# Altium schematic sheet VIDEO_Interface.SchDoc
size A4; SheetNumber: 9; SheetTotal: 16
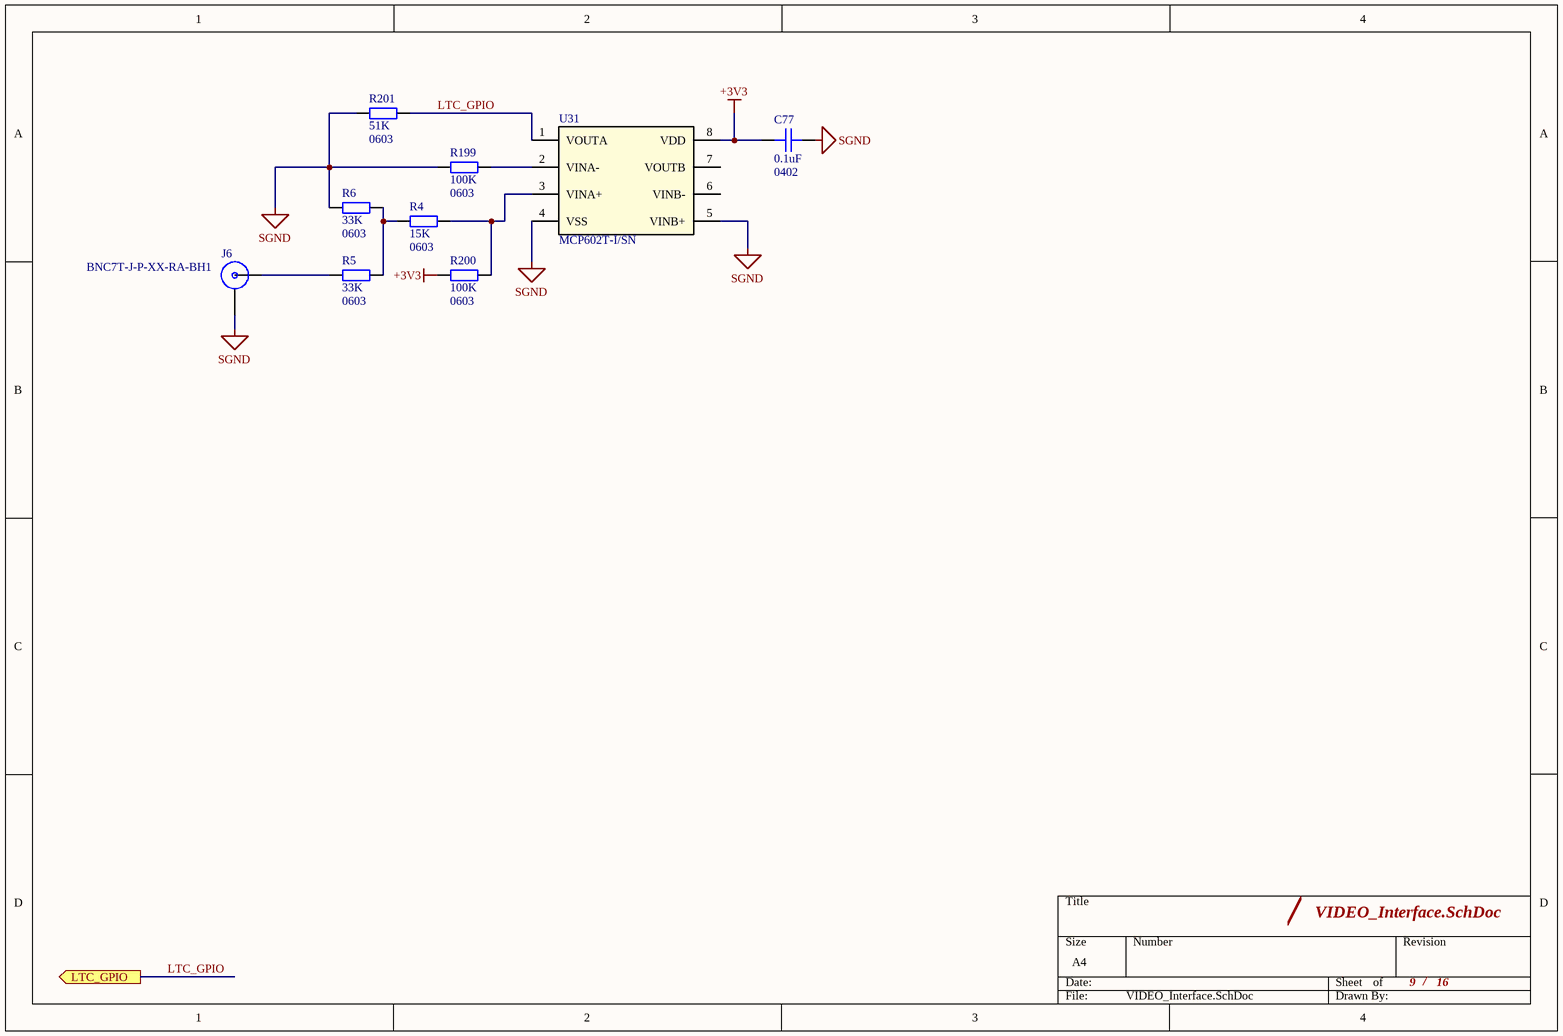
[diagram p0: VIDEO_Interface.SchDoc]

## Parts
C77  Capacitance: 0.1uF  Package1: 0402  [CAPC100x50x50L25]  (hidden comment: 04023C104KAT2A)
J6  BNC7T-J-P-XX-RA-BH1  [SAMTEC_BNC7T-J-P-XX-RA-BH1]
R4  Resistance: 15K  Size2: 0603  [RESC160X80X55L30]  (hidden comment: RC0603FR-0715KL)
R5  Resistance: 33K  Size2: 0603  [RESC160X80X55L30]  (hidden comment: RC0603FR-0733KL)
R6  Resistance: 33K  Size2: 0603  [RESC160X80X55L30]  (hidden comment: RC0603FR-0733KL)
R199  Resistance: 100K  Size2: 0603  [RESC160X80X55L30]  (hidden comment: RC0603FR-07100KL)
R200  Resistance: 100K  Size2: 0603  [RESC160X80X55L30]  (hidden comment: RC0603FR-07100KL)
R201  Resistance: 51K  Size2: 0603  [RESC160X80X55L30]  (hidden comment: RC0603FR-0751KP)
U31  MCP602T-I/SN  [SOIC8-N_MC_MCH]

## Ports
LTC_GPIO (out)

## Nets
+3V3: C77.2 R200.1 U31.8(VDD)
SGND: C77.1 J6.2 R6.1 R199.1 R201.2 U31.4(VSS) U31.5(VINB+)
LTC_GPIO: R201.1 U31.1(VOUTA) ; port LTC_GPIO
NetJ6_1: J6.1 R5.2
NetR4_1: R4.1 R5.1 R6.2
NetR4_2: R4.2 R200.2 U31.3(VINA+)
NetR199_2: R199.2 U31.2(VINA-)

Not connected (* = marked no-connect by the designer): U31 6(VINB-) 7(VOUTB)

## Notes on the sheet
- /

## Library data of the parts
C77 = CMP-001-0374-4: 0402 25V X7R 100 NF 10%; Manufacturer: KYOCERA AVX; Op Temp max: 85°C; Op Temp min: -55°C; ComponentLink3URL: https://www.digikey.com/en/products/detail/yageo/CC0402MRX5R5BB106/5195138; MPN: 04023C104KAT2A; ComponentLink1URL: https://www.yageo.com/upload/media/product/productsearch/datasheet/mlcc/UPY-GPHC_X5R_4V-to-50V_26.pdf; Package: 0402 (1005 Metric); Size: 1.00mm x 0.50mm; Height max: 700µm; Mounting Type: SM; Tolerance: 10%; ComponentLink1Description: Datasheet; ComponentLink3Description: Digikey; Ratings: -; Dielectric: X7R; ComponentLink2Description: Mouser; ComponentLink2URL: https://eu.mouser.com/ProductDetail/YAGEO/CC0402MRX5R5BB106?qs=zEY9bCHj09eCmUJdZuS5Lg%3D%3D; Lead Spacing: 0mm; Component Type: Ceramic Capacitor; Voltage Rating: 25V
J6 = BNC7T-J-P-XX-RA-BH1: CONN BNC JACK R/A 75 OHM PCB; MPN: BNC7T-J-P-HN-RA-BH1; MF: Samtec; Check_prices: https://www.snapeda.com/parts/BNC7T-J-P-HN-RA-BH1/Samtec+Inc./view-part/?ref=eda; Availability: In Stock; Price: None; Package: None; SnapEDA_Link: https://www.snapeda.com/parts/BNC7T-J-P-HN-RA-BH1/Samtec+Inc./view-part/?ref=snap; Purchase-URL: https://pricing.snapeda.com/search/part/BNC7T-J-P-HN-RA-BH1/?ref=eda; ComponentLink1Description: DigiKey; ComponentLink1URL: https://www.digikey.com/en/products/detail/samtec-inc/BNC7T-J-P-HN-RA-BH1/6642961; ComponentLink2Description: Datasheet; ComponentLink2URL: https://suddendocs.samtec.com/prints/bnc7t-j-p-xx-ra-bh1-mkt.pdf
R4 = CMP-001-0628-7: RES 15K OHM 1% 1/10W 0603; Manufacturer: YAGEO; Power: 100mW; Temperature Coefficient: ±100ppm; Op Temp max: 155°C; Op Temp min: -55°C; Ratings: -; ComponentLink3URL: https://www.digikey.com/en/products/detail/yageo/RC0603FR-0710KL/726880?s=N4IgTCBcDaIEoGEAMA2JBmAYnAtEg7AIxIDSAMiALoC%2BQA; Size: 1.60mm x 0.80mm; ComponentLink1Description: Datasheet; ComponentLink3Description: Digikey; ComponentLink2Description: Mouser; ComponentLink1URL: https://www.yageo.com/upload/media/product/products/datasheet/rchip/PYu-RC_51_RoHS_P_4.pdf; Composition: Thick Film; Package: 0603 (1608 Metric); ComponentLink2URL: https://eu.mouser.com/ProductDetail/YAGEO/RC0603FR-0710KL?qs=grNVn54RoB%252B3GtjbJj3wJQ%3D%3D; Mounting Type: SM; Tolerance: 1%; Height max: 550µm; MPN: RC0603FR-0715KL; Component Type: Chip Resistor
R5 R6 = CMP-001-0628-7: RES 33K OHM 1% 1/10W 0603; Manufacturer: YAGEO; Power: 100mW; Temperature Coefficient: ±100ppm; Op Temp max: 155°C; Op Temp min: -55°C; Ratings: -; ComponentLink3URL: https://www.digikey.com/en/products/detail/yageo/RC0603FR-0710KL/726880?s=N4IgTCBcDaIEoGEAMA2JBmAYnAtEg7AIxIDSAMiALoC%2BQA; Size: 1.60mm x 0.80mm; ComponentLink1Description: Datasheet; ComponentLink3Description: Digikey; ComponentLink2Description: Mouser; ComponentLink1URL: https://www.yageo.com/upload/media/product/products/datasheet/rchip/PYu-RC_51_RoHS_P_4.pdf; Composition: Thick Film; Package: 0603 (1608 Metric); ComponentLink2URL: https://eu.mouser.com/ProductDetail/YAGEO/RC0603FR-0710KL?qs=grNVn54RoB%252B3GtjbJj3wJQ%3D%3D; Mounting Type: SM; Tolerance: 1%; Height max: 550µm; MPN: RC0603FR-0733KL; Component Type: Chip Resistor
R199 R200 = CMP-001-0628-7: RES 100K OHM 1% 1/10W 0603; Manufacturer: YAGEO; Power: 100mW; Temperature Coefficient: ±100ppm; Op Temp max: 155°C; Op Temp min: -55°C; Ratings: -; ComponentLink3URL: https://www.digikey.com/en/products/detail/yageo/RC0603FR-0710KL/726880?s=N4IgTCBcDaIEoGEAMA2JBmAYnAtEg7AIxIDSAMiALoC%2BQA; Size: 1.60mm x 0.80mm; ComponentLink1Description: Datasheet; ComponentLink3Description: Digikey; ComponentLink2Description: Mouser; ComponentLink1URL: https://www.yageo.com/upload/media/product/products/datasheet/rchip/PYu-RC_51_RoHS_P_4.pdf; Composition: Thick Film; Package: 0603 (1608 Metric); ComponentLink2URL: https://eu.mouser.com/ProductDetail/YAGEO/RC0603FR-0710KL?qs=grNVn54RoB%252B3GtjbJj3wJQ%3D%3D; Mounting Type: SM; Tolerance: 1%; Height max: 550µm; MPN: RC0603FR-07100KL; Component Type: Chip Resistor
R201 = CMP-001-0628-7: RES 51K OHM 1% 1/10W 0603; Manufacturer: YAGEO; Power: 100mW; Temperature Coefficient: ±100ppm; Op Temp max: 155°C; Op Temp min: -55°C; Ratings: -; ComponentLink3URL: https://www.digikey.com/en/products/detail/yageo/RC0603FR-0710KL/726880?s=N4IgTCBcDaIEoGEAMA2JBmAYnAtEg7AIxIDSAMiALoC%2BQA; Size: 1.60mm x 0.80mm; ComponentLink1Description: Datasheet; ComponentLink3Description: Digikey; ComponentLink2Description: Mouser; ComponentLink1URL: https://www.yageo.com/upload/media/product/products/datasheet/rchip/PYu-RC_51_RoHS_P_4.pdf; Composition: Thick Film; Package: 0603 (1608 Metric); ComponentLink2URL: https://eu.mouser.com/ProductDetail/YAGEO/RC0603FR-0710KL?qs=grNVn54RoB%252B3GtjbJj3wJQ%3D%3D; Mounting Type: SM; Tolerance: 1%; Height max: 550µm; MPN: RC0603FR-0751KP; Component Type: Chip Resistor
U31 = MCP602T-ISN: No Description Available; Mfr_Name: Microchip; Copyright: Copyright (C) 2024 Ultra Librarian. All rights reserved.; MPN: MCP602T-I/SN; RefDes: RefDes; Type: DEV